# Altium schematic sheet BuckBoost+GateDriver_Schematic 1.SchDoc
size B; SheetNumber: 1; SheetTotal: 1
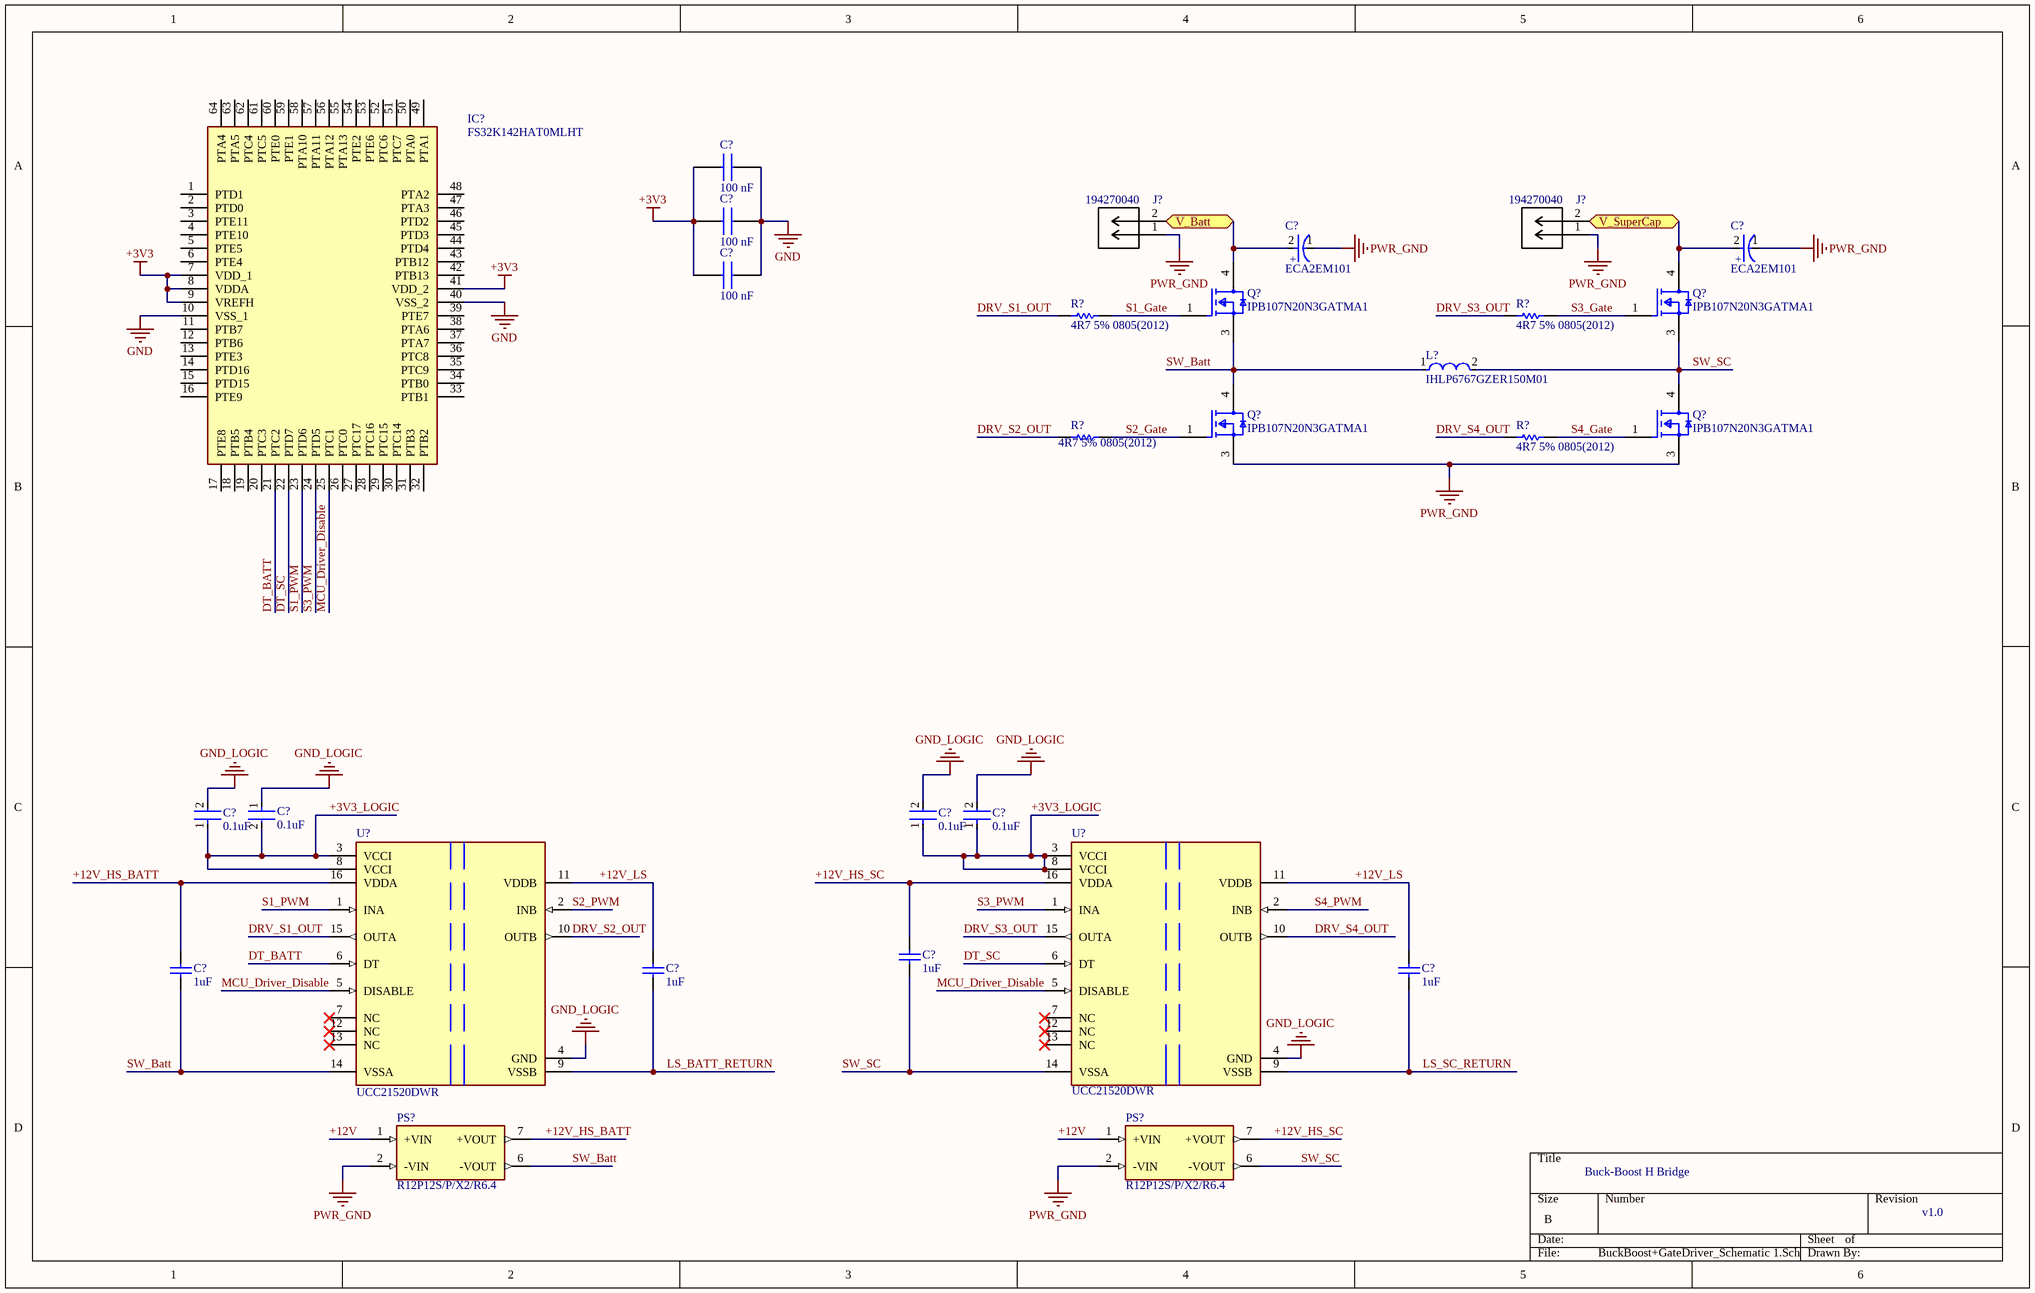
[diagram p0: BuckBoost+GateDriver_Schematic 1.SchDoc]

## Parts
(Parts that share a designator on the sheet are numbered #1, #2 ... from top to bottom, then left to right.)
C?#1  100 nF  [CAP_0603]
C?#2  100 nF  [CAP_0603]
C?#3  ECA2EM101  [FP-RAD-TH-D_16_0_5-L_31_5-MFG]
C?#4  ECA2EM101  [FP-RAD-TH-D_16_0_5-L_31_5-MFG]
C?#5  100 nF  [CAP_0603]
C?#6  0.1uF  [FP-GRM033-0_03-IPC_A]
C?#7  0.1uF  [FP-GRM033-0_03-IPC_A]
C?#8  0.1uF  [FP-GRM033-0_03-IPC_A]
C?#9  0.1uF  [FP-GRM033-0_03-IPC_A]
C?#10  1uF  [CAPC1609X100X15LL20]
C?#11  1uF  [CAPC1609X100X15LL20]
C?#12  1uF  [CAPC1609X100X15LL20]
C?#13  1uF  [CAPC1609X100X15LL20]
IC?  FS32K142HAT0MLHT  [QFP50P1200X1200X160-64N]
J?#1  194270040  [*CONN_SD-19427-018_MOL]
J?#2  194270040  [*CONN_SD-19427-018_MOL]
L?  IHLP6767GZER150M01  [FP-IHLP-6767GZ-FP_3_825x1-MFG]
PS?#1  R12P12S/P/X2/R6.4  [CONV_R12P12S/P/X2/R6.4]
PS?#2  R12P12S/P/X2/R6.4  [CONV_R12P12S/P/X2/R6.4]
Q?#1  IPB107N20N3GATMA1  [FP-PG-TO263-3-MFG]
Q?#2  IPB107N20N3GATMA1  [FP-PG-TO263-3-MFG]
Q?#3  IPB107N20N3GATMA1  [FP-PG-TO263-3-MFG]
Q?#4  IPB107N20N3GATMA1  [FP-PG-TO263-3-MFG]
R?#1  4R7 5% 0805(2012)  [RESC0805(2012)_M]
R?#2  4R7 5% 0805(2012)  [RESC0805(2012)_M]
R?#3  4R7 5% 0805(2012)  [RESC0805(2012)_M]
R?#4  4R7 5% 0805(2012)  [RESC0805(2012)_M]
U?#1  UCC21520DWR  [FP-DW0016B-IPC_B]
U?#2  UCC21520DWR  [FP-DW0016B-IPC_B]

## Ports
V_Batt (bidir), V_SuperCap (bidir)

## Nets
+3V3: C?#1.1 C?#2.1 C?#5.1 IC?.7(VDD_1) IC?.8(VDDA) IC?.9(VREFH) IC?.41(VDD_2)
GND: C?#1.2 C?#2.2 C?#5.2 IC?.10(VSS_1) IC?.40(VSS_2)
GND_LOGIC: C?#6.1 C?#7.2 C?#8.2 C?#9.2 U?#1.4(GND) U?#2.4(GND)
PWR_GND: C?#3.1(C) C?#4.1(C) J?#1.1 J?#2.1 PS?#1.2(-VIN) PS?#2.2(-VIN) Q?#3.3(SOURCE) Q?#4.3(SOURCE)
+3V3_LOGIC: C?#6.2 C?#7.1 C?#8.1 C?#9.1 U?#1.3(VCCI) U?#1.8(VCCI) U?#2.3(VCCI) U?#2.8(VCCI)
+12V: PS?#1.1(+VIN) PS?#2.1(+VIN)
+12V_HS_BATT: C?#11.1 PS?#1.7(+VOUT) U?#1.16(VDDA)
+12V_HS_SC: C?#10.1 PS?#2.7(+VOUT) U?#2.16(VDDA)
+12V_LS: C?#12.1 C?#13.1 U?#1.11(VDDB) U?#2.11(VDDB)
DRV_S1_OUT: R?#1.1 U?#1.15(OUTA)
DRV_S2_OUT: R?#3.1 U?#1.10(OUTB)
DRV_S3_OUT: R?#2.1 U?#2.15(OUTA)
DRV_S4_OUT: R?#4.1 U?#2.10(OUTB)
DT_BATT: IC?.21(PTC2) U?#1.6(DT)
DT_SC: IC?.22(PTD7) U?#2.6(DT)
LS_BATT_RETURN: C?#12.2 U?#1.9(VSSB)
LS_SC_RETURN: C?#13.2 U?#2.9(VSSB)
MCU_Driver_Disable: IC?.25(PTC1) U?#1.5(DISABLE) U?#2.5(DISABLE)
S1_Gate: Q?#1.1(GATE) R?#1.2
S1_PWM: IC?.23(PTD6) U?#1.1(INA)
S2_Gate: Q?#3.1(GATE) R?#3.2
S2_PWM: U?#1.2(INB)
S3_Gate: Q?#2.1(GATE) R?#2.2
S3_PWM: IC?.24(PTD5) U?#2.1(INA)
S4_Gate: Q?#4.1(GATE) R?#4.2
S4_PWM: U?#2.2(INB)
SW_Batt: C?#11.2 L?.1 PS?#1.6(-VOUT) Q?#1.3(SOURCE) Q?#3.4(DRAIN) U?#1.14(VSSA)
SW_SC: C?#10.2 L?.2 PS?#2.6(-VOUT) Q?#2.3(SOURCE) Q?#4.4(DRAIN) U?#2.14(VSSA)
V_Batt: C?#3.2(A) J?#1.2 Q?#1.4(DRAIN) ; port V_Batt
V_SuperCap: C?#4.2(A) J?#2.2 Q?#2.4(DRAIN) ; port V_SuperCap

Not connected (* = marked no-connect by the designer): IC? 1(PTD1) 2(PTD0) 3(PTE11) 4(PTE10) 5(PTE5) 6(PTE4) 11(PTB7) 12(PTB6) 13(PTE3) 14(PTD16) 15(PTD15) 16(PTE9) 17(PTE8) 18(PTB5) 19(PTB4) 20(PTC3) 26(PTC0) 27(PTC17) 28(PTC16) 29(PTC15) 30(PTC14) 31(PTB3) 32(PTB2) 33(PTB1) 34(PTB0) 35(PTC9) 36(PTC8) 37(PTA7) 38(PTA6) 39(PTE7) 42(PTB13) 43(PTB12) 44(PTD4) 45(PTD3) 46(PTD2) 47(PTA3) 48(PTA2) 49(PTA1) 50(PTA0) 51(PTC7) 52(PTC6) 53(PTE6) 54(PTE2) 55(PTA13) 56(PTA12) 57(PTA11) 58(PTA10) 59(PTE1) 60(PTE0) 61(PTC5) 62(PTC4) 63(PTA5) 64(PTA4); U?#1 7(NC)* 12(NC)* 13(NC)*; U?#2 7(NC)* 12(NC)* 13(NC)*

## Notes on the sheet
- Buck-Boost H Bridge
- v1.0
- (in symbol CMP-05427-001125-1) +

## Library data of the parts
C?#1 C?#2 C?#5 = 100 nF Capacitor, 0603: Multilayer Ceramic Capacitors MLCC - SMD/SMT KGM15BR71H104JT NEW GLOBAL PN 50V 0.1uF A 581-KGM15BR71H104JT; Manufacturer 1: KYOCERA AVX; Manufacturer Part Number 1: 06035C104JAT2A; MPN: 581-06035C104JAT2A; Tolerance: 5%; Value: 100 nF; Voltage: 50 V; Package: 0603; Library Ref: Capacitor_BASE; Design Item ID: 100 nF Capacitor, 0603; Supplier 1: Mouser
C?#3 C?#4 = CMP-05427-001125-1: Aluminum Electrolytic Capacitors (Radial Lead Type) 100uF ±20% 250V; Lead Diameter: 0.8mm; Lead/Base Style: Straight; Dielectric Material: Aluminium; Polarity: Polar; Ripple Current: 530mA; Life (Hours): 2000Hour; Dissipation Factor: 0.18%; Lead Pitch: 7.5mm; Size: 31.5mm; Capacitance: 100uF; Diameter: 16mm; Voltage Rating (DC): 250V; Package Quantity: 100; RoHS Compliant: Yes; Voltage: 250V; Mount: Through Hole; Height: 31.5mm; Packaging: Bulk; Series: M; Tolerance: 20%; Max Operating Temperature: 85°C; REACH SVHC: No SVHC; Min Operating Temperature: -25°C; Length: 31.5mm; Height - Seated (Max): 1.319inch; Lead Free: Lead Free; Case/Package: Radial; Construction: RADIAL; Radiation Hardening: No; Voltage Rating: 250V; Termination: Radial
C?#6-C?#9 = CMP-06035-030942-1: Chip Multilayer Ceramic Capacitors for General Purpose, 0201, 0.10uF, X6S, 22%, 10%, 6.3V; Capacitance: 100nF; Dielectric: X6S; Thickness: 300um; Tolerance: 10%; Voltage Rating (DC): 6.3V; Width: 300um; Length: 600um
C?#10-C?#13 = CMP-2006-00183-1: TACL105K006XTA; Manufacturer: AVX Interconnect / Elco; Part Number: TACL105K006XTA
IC? = FS32K142HAT0MLHT: Integrated Circuit; Manufacturer_Name: NXP; Datasheet Link: https://datasheet.datasheetarchive.com/originals/distributors/DKDS42/DSANUWW0047967.pdf; Height: 1.6mm; Manufacturer_Part_Number: FS32K142HAT0MLHT; Mouser Part Number: 771-FS32K142HAT0MLHT; Mouser Price/Stock: https://www.mouser.co.uk/ProductDetail/NXP-Semiconductors/FS32K142HAT0MLHT?qs=W0yvOO0ixfHOt6NwcnDRUQ%3D%3D; Arrow Part Number: FS32K142HAT0MLHT; Arrow Price/Stock: https://www.arrow.com/en/products/fs32k142hat0mlht/nxp-semiconductors?region=nac
L? = CMP-02424-000082-1: Commercial Inductors, High Saturation Series 15uH 12.5A 19.9mΩ 20%; DC Resistance (DCR): 19.9mR; Self Resonant Frequency: 2MHz; Saturation Current: 25A; Core Material: Metal; Shielding: Shielded; Test Frequency: 100kHz; Inductance: 15uH; Depth: 17.15mm; Case/Package: 6767; Height - Seated (Max): 0.157inch; Mount: Surface Mount; Contact Plating: Tin; Radiation Hardening: No; Tolerance: 20%; Lead Free: Lead Free; Military Standard: Not; Height: 7mm; Width: 0.675inch; Max Operating Temperature: 125°C; Packaging: Tape and Reel; Min Operating Temperature: -55°C; Package Quantity: 200; Length: 17.28mm; Termination: SMD/SMT; Current Rating: 12.5A; Max DC Current: 25A
PS?#1 PS?#2 = R12P12S/P/X2/R6.4: 1 Watt SIP7 Single and Dual Output; Package: None; Price: None; Value: *; MP: R12P12S/P/X2/R6.4; Availability: Unavailable
Q?#1-Q?#4 = CMP-00196-21386550-1: IPB107N20N3GATMA1 MOSFET Transistor, N Channel, 88 A, 200 V, 0.0096 ohm, 10 V, 3 V; Max Junction Temperature (Tj): 175°C; Turn-Off Delay Time: 41ns; Gate to Source Voltage (Vgs): 20V; Drain to Source Breakdown Voltage: 200V; Continuous Drain Current (ID): 88A; Number of Elements: 1; Fall Time: 11ns; Power Dissipation: 300W; Drain to Source Resistance: 9.6mΩ; Turn-On Delay Time: 18ns; Rise Time: 26ns; On-State Resistance: 10.7mΩ; Input Capacitance: 5.34nF; Packaging: Tape & Reel; Package Quantity: 1000; Height: 4.7mm; Schedule B: 8541290080, 8541290080|8541290080|8541290080|8541290080|8541290080; Case/Package: TO-263; RoHS: Compliant; Mount: Surface Mount; Number of Pins: 3; Max Operating Temperature: 175°C; Number of Channels: 1; Lifecycle Status: Production; Drain to Source Voltage (Vdss): 200V; Min Operating Temperature: -55°C; NexarPartId: 21386550
R?#1-R?#4 = CMP-1013-00018-1: 4R7 0.125W 5% 0805 (2012 Metric)  SMD; Value: 4.70 Ohm; Case-Metric: 2012; Case-EIA: 0805; Tolerance: 5 %; Technology: SMT; Power: 0.125 W
U?#1 U?#2 = CMP-04912-000096-1: DGTL ISO 5.7KV GATE DRVR 16SOIC; Number of Channels: 2; Working Voltage: 2.121kV; Case/Package: SOIC; Lead Free: Lead Free; Max Operating Temperature: 125°C; Min Operating Temperature: -40°C; RoHS Compliant: Yes
J?#1 J?#2 = 194270040: SnapEDA_Link: https://www.snapeda.com/parts/194270040/Molex/view-part/?ref=snap; Check_prices: https://www.snapeda.com/parts/194270040/Molex/view-part/?ref=eda; Value: *